# Altium schematic sheet Probe_Connectors.SchDoc: Input Connector
size A4; SheetNumber: 000; SheetTotal: 999
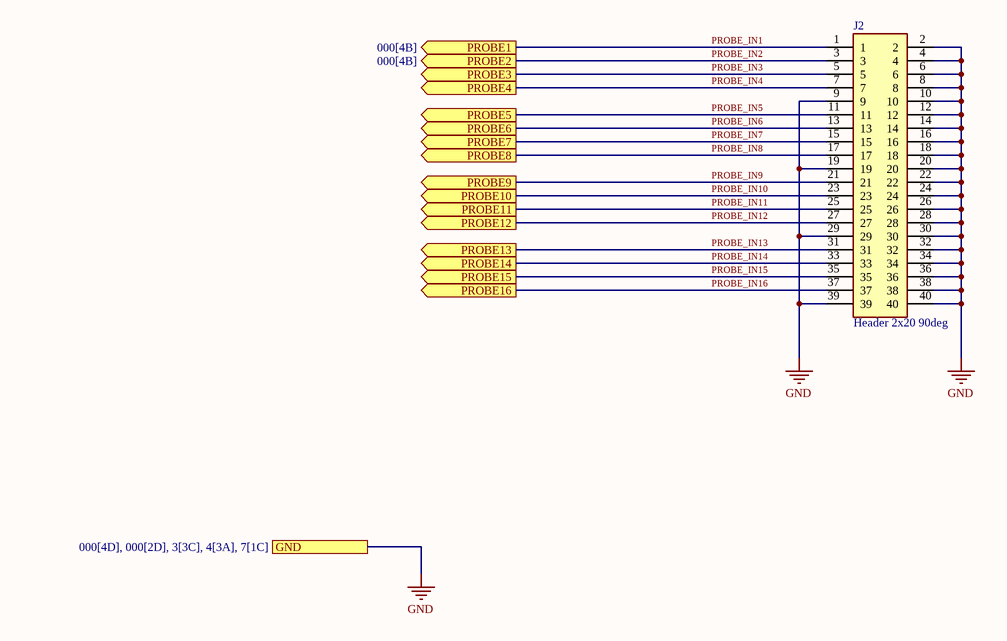
[diagram p0: Probe_Connectors.SchDoc]

## Parts
J2  Header 2x20 90deg  [SULLINS_PPPC202LJBN-RC]

## Ports
GND (see 000[4D], 000[2D], 3[3C], 4[3A], 7[1C]), PROBE1 (out, see 000[4B]), PROBE2 (out, see 000[4B]), PROBE3 (out), PROBE4 (out), PROBE5 (out), PROBE6 (out), PROBE7 (out), PROBE8 (out), PROBE9 (out), PROBE10 (out), PROBE11 (out), PROBE12 (out), PROBE13 (out), PROBE14 (out), PROBE15 (out), PROBE16 (out)

## Nets
GND: J2.2 J2.4 J2.6 J2.8 J2.9 J2.10 J2.12 J2.14 J2.16 J2.18 J2.19 J2.20 J2.22 J2.24 J2.26 J2.28 J2.29 J2.30 J2.32 J2.34 J2.36 J2.38 J2.39 J2.40 ; port GND
PROBE_IN1: J2.1 ; port PROBE1
PROBE_IN2: J2.3 ; port PROBE2
PROBE_IN3: J2.5 ; port PROBE3
PROBE_IN4: J2.7 ; port PROBE4
PROBE_IN5: J2.11 ; port PROBE5
PROBE_IN6: J2.13 ; port PROBE6
PROBE_IN7: J2.15 ; port PROBE7
PROBE_IN8: J2.17 ; port PROBE8
PROBE_IN9: J2.21 ; port PROBE9
PROBE_IN10: J2.23 ; port PROBE10
PROBE_IN11: J2.25 ; port PROBE11
PROBE_IN12: J2.27 ; port PROBE12
PROBE_IN13: J2.31 ; port PROBE13
PROBE_IN14: J2.33 ; port PROBE14
PROBE_IN15: J2.35 ; port PROBE15
PROBE_IN16: J2.37 ; port PROBE16

## Notes on the sheet
- Title:
- Author:
- Size:
- Date:
- Git Hash:
- A4
- Prj:
- SW Version:
- Variant:
- Edited:
- File:

## Library data of the parts
J2 = CON-HDR-90DEG-F-2x20-2.54mm: Female header 2x20 2.54mm THT